# Altium project ARC_1.0.5.PrjPcb (part 3 of 3)

## Sheet Current_Sense_Section.SchDoc
size A4; DocumentNumber: 3; SheetNumber: 3; SheetTotal: 7
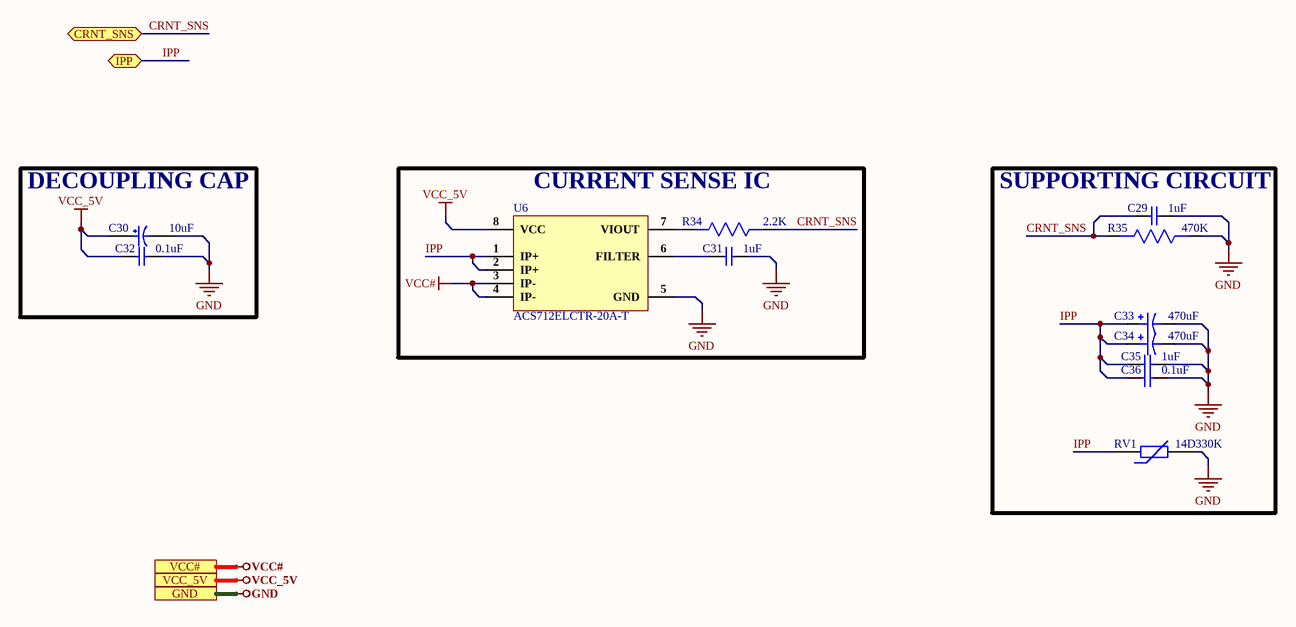
[diagram p5: Current_Sense_Section.SchDoc]

### Parts
C29  1uF  [Cap0603]
C30  10uF  [RVT1E100M0405.]
C31  1uF  [Cap0603]
C32  0.1uF  [Cap0603]
C33  470uF  [VT1H471MI135000CE0]
C34  470uF  [VT1H471MI135000CE0]
C35  1uF  [Cap0603]
C36  0.1uF  [Cap0603]
R34  2.2K  [Res0603]
R35  470K  [Res0603]
RV1  14D330K  [14D330K]
U6  ACS712ELCTR-20A-T  [SOIC-8]

### Blocks framed on the sheet
DECOUPLING CAP: C30 C32
CURRENT SENSE IC: C31 R34 U6
SUPPORTING CIRCUIT: C29 C33-C36 R35 RV1

### Ports
CRNT_SNS (bidir), GND, IPP (bidir), VCC#, VCC_5V

### Nets
GND: C29.2 C30.2 C31.2 C32.2 C33.2 C34.2 C35.2 C36.2 R35.1 RV1.2 U6.5(GND) ; port GND
VCC#: U6.3(IP-) U6.4(IP-) ; port VCC#
VCC_5V: C30.1 C32.1 U6.8(VCC) ; port VCC_5V
CRNT_SNS: C29.1 R34.1 R35.2 ; port CRNT_SNS
IPP: C33.1 C34.1 C35.1 C36.1 RV1.1 U6.1(IP+) U6.2(IP+) ; port IPP
NetC31_1: C31.1 U6.6(FILTER)
NetR34_2: R34.2 U6.7(VIOUT)

### Notes on the sheet
- 1
- Huzaifa Ali

### Library data of the parts
C29 C31 C35 = CL10A105KA8NNNC: CAP CER 1UF 25V X5R 0603; Manufacturer: Sams; Tolerance: 10%; Supplier 1: Digi-Key; Manufacturer Part Number: CL10A105KA8NNNC; Stock 1: 2768758; Pricing 1: 1=0.1, 10=0.036, 50=0.0198, 100=0.0161, 500=0.01152, 1000=0.00904 (USD); Mount: Surface Mount; Case/Package: 0603; Min Operating Temperature: -55°C; Max Operating Temperature: 85°C; Capacitance: 1uF; Dielectric: X5R; Voltage Rating (DC): 25V; Voltage: 25V; Length: 1.6mm; Height: 0.8mm; Depth: 0.8mm; Lead Free: Lead Free; Supplier Part Number 1: 1276-1102-1-ND
C30 = RVT1E100M0405: CAP ALUM 10uF 25V SMD; Manufacturer: ROQANG; φD: 4mm; L: 5.4mm; Tolerance: ±20%; Operating Temperature: -45℃~+105℃; Rated Voltage: 25V; Capacitance: 10uF
C32 C36 = CC0603KRX7R0BB104: CAP CER 0.1UF 100V X7R 0603; Manufacturer: Yageo; Capacitance: 100nF; Tolerance: 10%; Supplier 1: Digi-Key; Manufacturer Part Number: CC0603KRX7R0BB104; RoHS: Yes; Category: Ceramic Capacitors; Stock 1: 60476; Pricing 1: 1=0.19000, 10=0.13500, 50=0.07680, 100=0.06370, 500=0.04466, 1000=0.03696 (USD); Mount: Surface Mount; Case/Package: 0603; Case Code (Metric): 1608; Case Code (Imperial): 0603; Weight: 7.1E-05oz; Min Operating Temperature: -55°C; Max Operating Temperature: 125°C; Package Quantity: 4000; Voltage Rating: 100V; Packaging: Tape and Reel; Dielectric: X7R; Termination: SMD/SMT; Resistor Type: Ceramic; Voltage Rating (DC): 100V; Series: CC; Length: 0.063inch; Width: 0.031inch; Thickness: 0.035inch; Depth: 0.8mm; Lead Free: Lead Free; RoHS Compliant: Yes; ComponentLink1URL: https://datasheet.ciiva.com/6277/mlccorderingcode-6277030.pdf?src-supplier=Digi-Key; ComponentLink1Description: https://datasheet.ciiva.com/6277/mlccorderingcode-6277030.pdf?src-supplier=Digi-Key; ComponentLink2URL: https://datasheet.ciiva.com/6277/mlccorderingcode-6277081.pdf?src-supplier=Digi-Key; ComponentLink2Description: https://datasheet.ciiva.com/6277/mlccorderingcode-6277081.pdf?src-supplier=Digi-Key; ComponentLink3URL: https://datasheet.ciiva.com/6277/mlccorderingcode-6277082.pdf?src-supplier=Digi-Key; ComponentLink3Description: https://datasheet.ciiva.com/6277/mlccorderingcode-6277082.pdf?src-supplier=Digi-Key; Supplier Part Number 1: 311-1523-1-ND
C33 C34 = VT1H471MI135000CE0: 470uF ±20% 50V 12.5mm 13.5mm 1000hrs 105℃ -40℃~+105℃ SMD,12.5x13.5mm Aluminum Electrolytic Capacitors - SMD RoHS; Manufacturer: Changzhou Huawei Elec; Package: SMD,12.5x13.5mm; Capacitance: 470uF; Tolerance: ±20%; Rated Voltage: 50V; φD: 12.5mm; L: 13.5mm; Lifetime @ Temp: 1000hrs 105℃; Operating Temperature: -40℃~+105℃
R34 = RC0603FR-072K2L: RES SMD 2.2K OHM 1% 1/10W 0603; Manufacturer: Yageo Phycomp; Temperature Coefficient: 100ppm/°C; Resistance: 2.2kR; Power Rating: 100mW; Voltage Rating (DC): 50V; Supplier 1: Digi-Key; Manufacturer Part Number: RC0603FR-072K2L; Stock 1: 10587920; Pricing 1: 1=0.1, 10=0.023, 100=0.0094, 1000=0.00421, 2500=0.00366 (USD); Mount: Surface Mount; Case/Package: 0603; Number of Pins: 2; Min Operating Temperature: -55°C; Max Operating Temperature: 155°C; Tolerance: 1%; Packaging: Cut Tape; Length: 1.6mm; Height: 0.45mm; Width: 800um; Depth: 0.8mm; REACH SVHC: No SVHC; Lead Free: Lead Free; Supplier Part Number 1: 311-2.20KHRCT-ND
R35 = AC0603JR-07470KL: RES SMD 470K OHM 5% 1/10W 0603; Manufacturer: Yageo; Resistance: 470kR; Power Rating: 100mW; Voltage Rating: 50V; Temperature Coefficient: 100ppm/°C; ComponentLink1URL: https://datasheet.ciiva.com/11820/0900766b80808d64-11820639.pdf?src-supplier=RSComponents; ComponentLink1Description: https://datasheet.ciiva.com/11820/0900766b80808d64-11820639.pdf?src-supplier=RSComponents; ComponentLink2URL: https://datasheet.ciiva.com/2487/rr-data-sheet-2487286.pdf?src-supplier=Digi-Key; ComponentLink2Description: https://datasheet.ciiva.com/2487/rr-data-sheet-2487286.pdf?src-supplier=Digi-Key; ComponentLink3URL: https://datasheet.ciiva.com/7984/87330-7984374.pdf?src-supplier=Element14; ComponentLink3Description: https://datasheet.ciiva.com/7984/87330-7984374.pdf?src-supplier=Element14; ComponentLink4URL: https://datasheet.ciiva.com/2487/rr-data-sheet-2487287.pdf?src-supplier=Digi-Key; ComponentLink4Description: https://datasheet.ciiva.com/2487/rr-data-sheet-2487287.pdf?src-supplier=Digi-Key; ComponentLink5URL: https://datasheet.ciiva.com/2487/rr-data-sheet-2487288.pdf?src-supplier=Digi-Key; ComponentLink5Description: https://datasheet.ciiva.com/2487/rr-data-sheet-2487288.pdf?src-supplier=Digi-Key; ComponentLink6URL: https://datasheet.ciiva.com/5759/87330-5759049.pdf?src-supplier=Farnell; ComponentLink6Description: https://datasheet.ciiva.com/5759/87330-5759049.pdf?src-supplier=Farnell; Supplier 1: Digi-Key; Manufacturer Part Number: AC0603JR-07470KL; Stock 1: 71; Pricing 1: 1=0.1, 10=0.024, 100=0.0097, 1000=0.0044, 2500=0.0038 (USD); Case/Package: 0603; Case Code (Imperial): 0603; Case Code (Metric): 1608; Weight: 7.1E-05oz; Min Operating Temperature: -55°C; Max Operating Temperature: 155°C; Tolerance: 5%; Packaging: Tape and Reel; Resistor Type: Thick Film; Termination: SMD/SMT; Number of Terminations: 2; Max Power Dissipation: 100mW; Features: Moisture Resistant,Automotive AEC-Q200; Series: AC; Length: 0.063inch; Width: 0.8mm; Height: 0.022inch; RoHS Compliant: Yes; ComponentLink7URL: http://www.mouser.com/ds/2/447/yageodocoutput-1111992.pdf?src-supplier=Mouser; ComponentLink7Description: http://www.mouser.com/ds/2/447/yageodocoutput-1111992.pdf?src-supplier=Mouser; Supplier Part Number 1: YAG3672DKR-ND
RV1 = 14D330K: 65V 5.9J 8500pF@1kHz 26V 20V 30V~36V 1kA Radial Leaded Varistors ROHS; Manufacturer: Hongzhi Elec; Manufacturer Part Number: 14D330K; Footprint: Radial; ComponentLink1Description: LCSC; ComponentLink1URL: https://lcsc.com/product-detail/Varistors_Hongzhi-Elec-14D330K_C137829.html
U6 = ACS712ELCTR-20A-T: SENSOR CURRENT HALL 20A AC/DC; Manufacturer: Allegro MicroSystems; Operating Supply Voltage: 5V; Output Current: 10mA; Max Supply Current: 13mA; Min Supply Voltage: 4.5V; Max Supply Voltage: 5.5V; Bandwidth: 80kHz; Number of Channels: 1; Response Time: 5us; Polarity: Bidirectional; Accuracy: 1.5%; Sensitivity: 100mV/A; Supplier 1: RSComponents; Manufacturer Part Number: ACS712ELCTR-20A-T; RoHS: Yes; Category: Magnetic Sensors; Stock 1: 93; Pricing 1: 1=6.70000, 25=4.23000, 100=3.64000, 250=3.35000, 500=3.04000 (GBP); Case/Package: SOIC; Number of Pins: 8; Min Operating Temperature: -40°C; Max Operating Temperature: 85°C; Package Quantity: 1; Frequency: 80kHz; Packaging: Tape and Reel; Termination: SMD/SMT; Quiescent Current: 10mA; Linearity: 1.5%; Current Sensing: 20A; Series: -; Length: 4.9mm; Width: 3.9mm; Height: 1.5mm; Radiation Hardening: No; REACH SVHC: No SVHC; Lead Free: Lead Free; RoHS Compliant: Yes; ComponentLink1URL: https://datasheet.ciiva.com/15099/getdatasheetpartid-312820-15099471.pdf?src-supplier=Verical; ComponentLink1Description: https://datasheet.ciiva.com/15099/getdatasheetpartid-312820-15099471.pdf?src-supplier=Verical; ComponentLink2URL: https://datasheet.ciiva.com/1165/64754-1165093.pdf?src-supplier=Element14; ComponentLink2Description: https://datasheet.ciiva.com/1165/64754-1165093.pdf?src-supplier=Element14; ComponentLink3URL: https://datasheet.ciiva.com/3272/acs712-datasheet-3272423.pdf?src-supplier=Avnet; ComponentLink3Description: https://datasheet.ciiva.com/3272/acs712-datasheet-3272423.pdf?src-supplier=Avnet; ComponentLink4URL: https://datasheet.ciiva.com/3271/acs712-datasheet-3271995.pdf?src-supplier=Avnet; ComponentLink4Description: https://datasheet.ciiva.com/3271/acs712-datasheet-3271995.pdf?src-supplier=Avnet; ComponentLink5URL: https://datasheet.ciiva.com/16636/acs712-datasheet-16636599.pdf?; ComponentLink5Description: https://datasheet.ciiva.com/16636/acs712-datasheet-16636599.pdf?; Supplier Part Number 1: 6807135

## Sheet RF_Receiver_Section.SchDoc
size 420 x 297 mm; DocumentNumber: 6; SheetNumber: 6; SheetTotal: 7
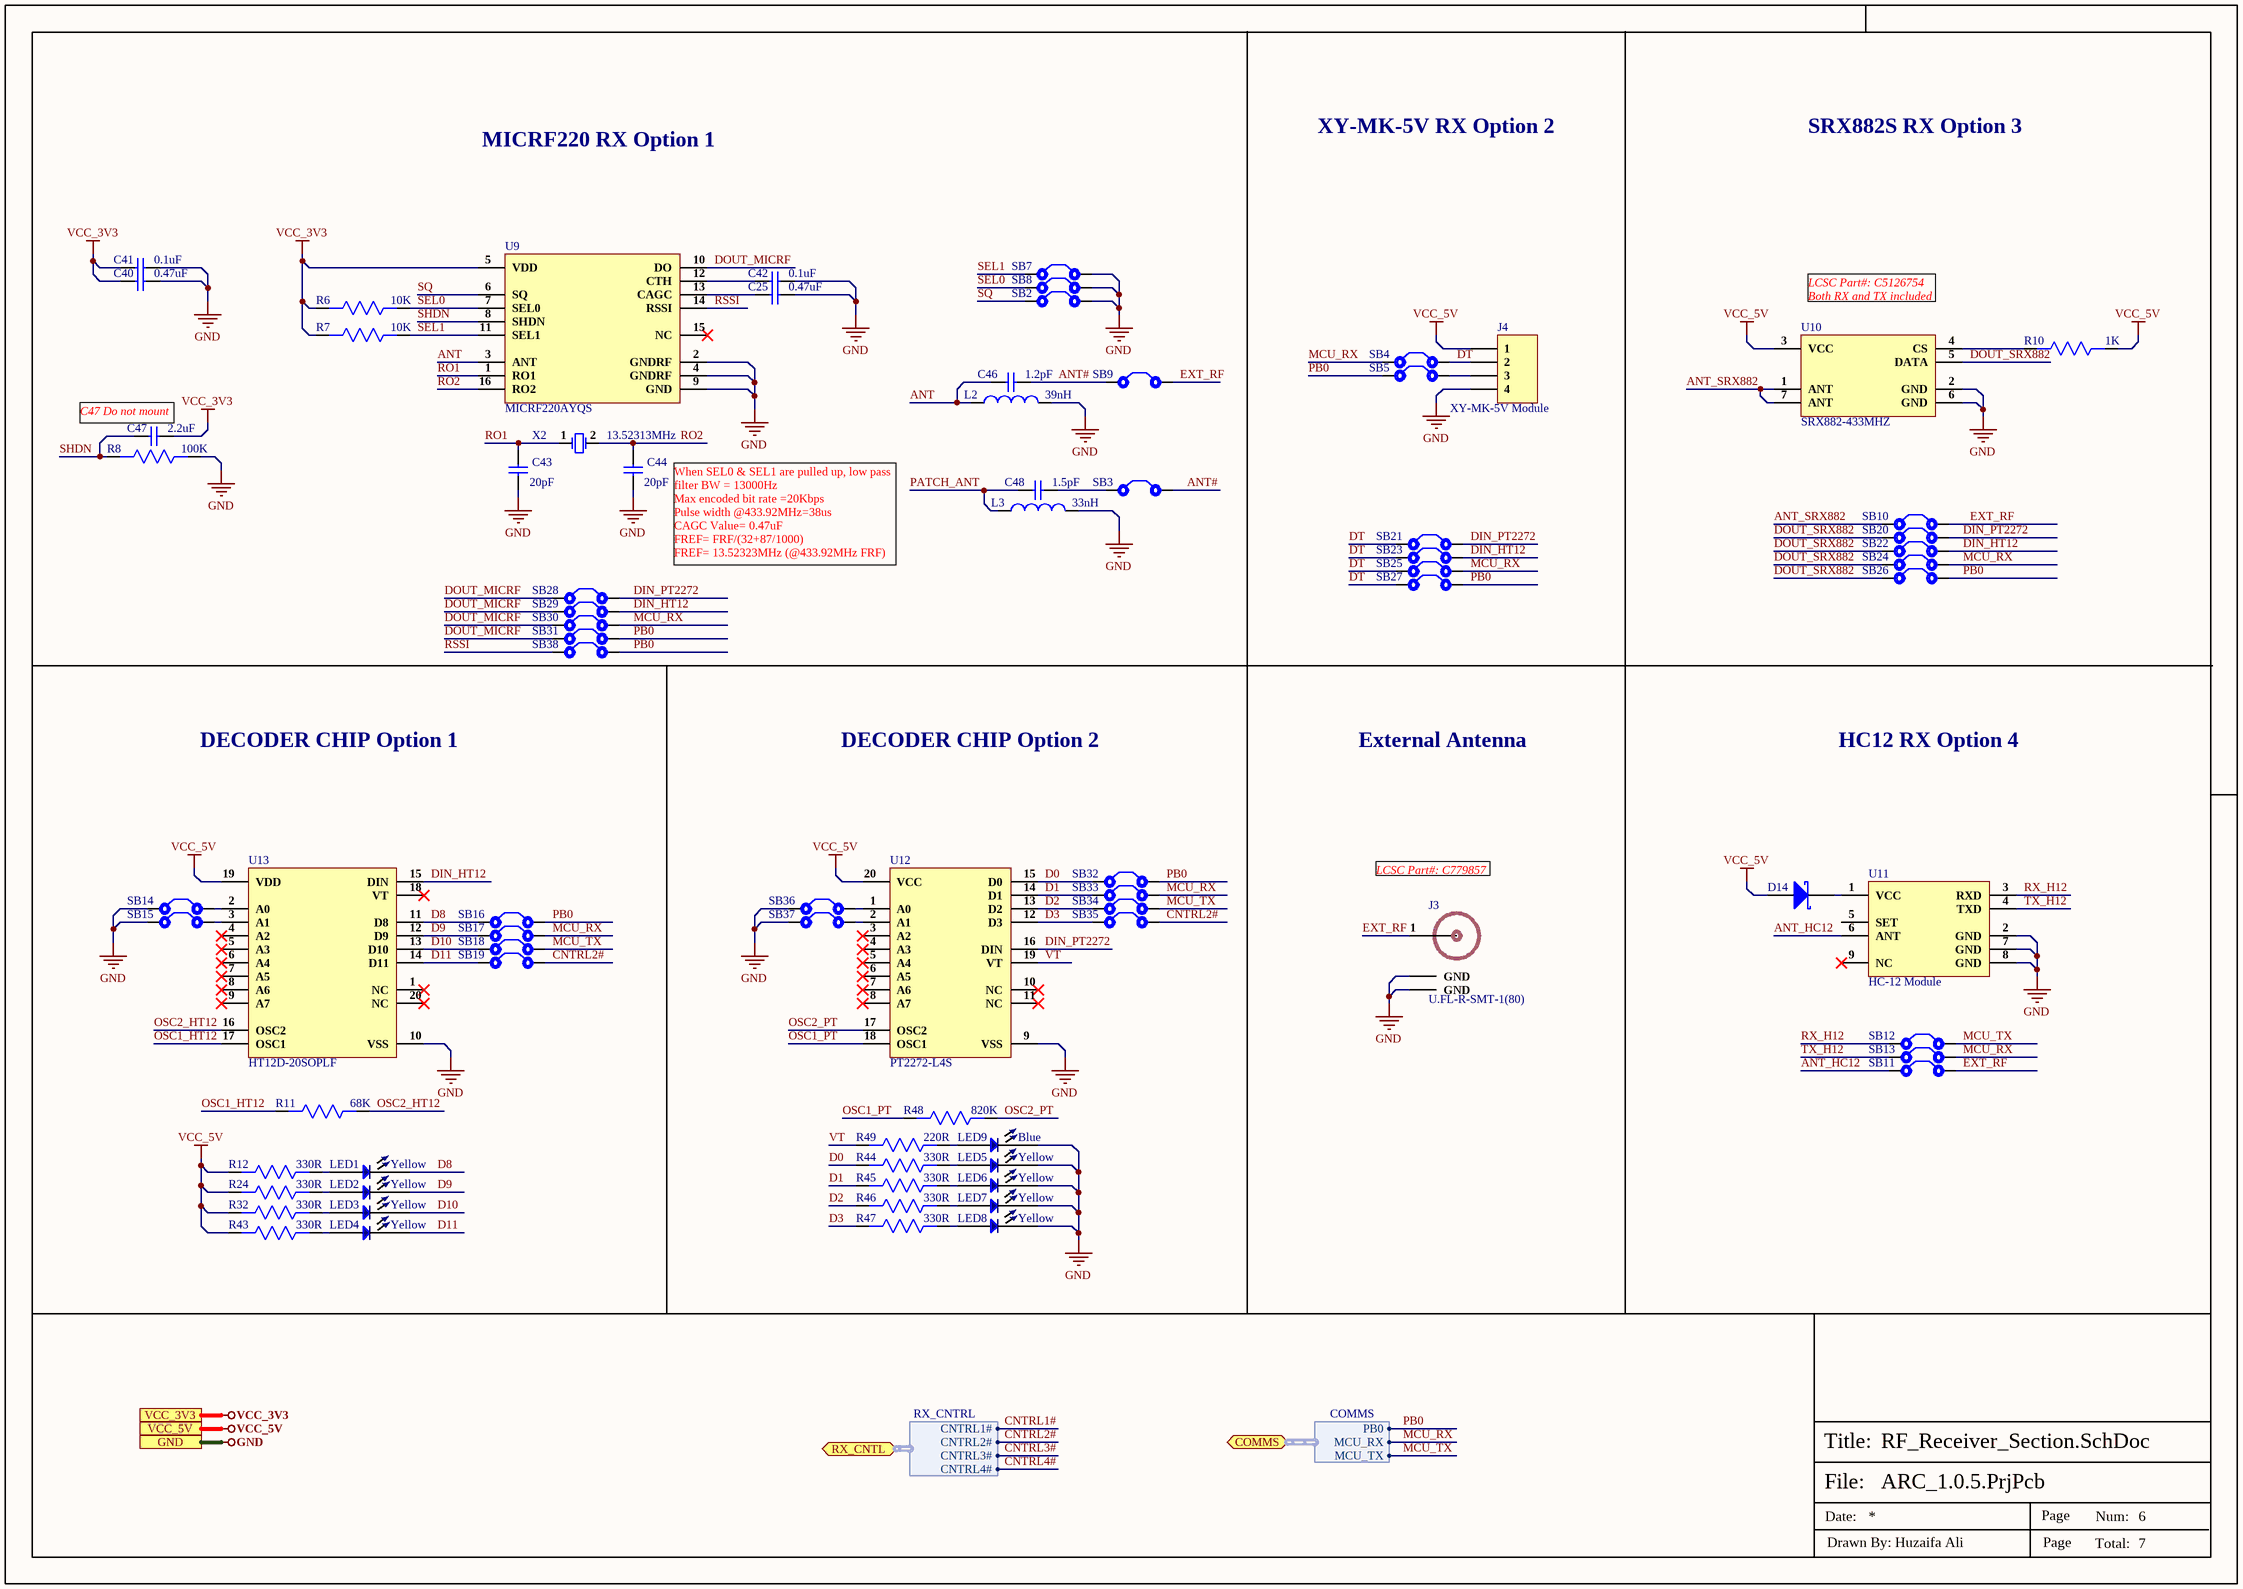
[diagram p6: RF_Receiver_Section.SchDoc]

### Parts
C25  0.47uF  [Cap0603]
C40  0.47uF  [Cap0603]
C41  0.1uF  [Cap0603]
C42  0.1uF  [Cap0603]
C43  20pF  [Cap-0603]
C44  20pF  [Cap-0603]
C46  1.2pF  [Cap0603]
C47  2.2uF  [Cap0603]
C48  1.5pF  [Cap0603]
D14  1N4148WS-7-F  [SOD-323]  (value not drawn)
J3  U.FL-R-SMT-1(80)  [U.FL-R-SMT-1(80)_]
J4  XY-MK-5V Module  [DW254W-11-04-85]
L2  39nH  [IND 0402]
L3  33nH  [IND 0603]
LED1  Yellow  [LED-0402]
LED2  Yellow  [LED-0402]
LED3  Yellow  [LED-0402]
LED4  Yellow  [LED-0402]
LED5  Yellow  [LED-0402]
LED6  Yellow  [LED-0402]
LED7  Yellow  [LED-0402]
LED8  Yellow  [LED-0402]
LED9  Blue  [LED-0402]
R6  10K  [Res0603]
R7  10K  [Res0603]
R8  100K  [Res0603]
R10  1K  [Res-0603]
R11  68K  [Res-0603]
R12  330R  [Res-0603]
R24  330R  [Res-0603]
R32  330R  [Res-0603]
R43  330R  [Res-0603]
R44  330R  [Res-0603]
R45  330R  [Res-0603]
R46  330R  [Res-0603]
R47  330R  [Res-0603]
R48  820K  [Res-0603]
R49  220R  [Res-0603]
SB2  Solder Bridge  [Solder Bridge]  (value not drawn)
SB3  Solder Bridge  [Solder Bridge]  (value not drawn)
SB4  Solder Bridge  [Solder Bridge]  (value not drawn)
SB5  Solder Bridge  [Solder Bridge]  (value not drawn)
SB7  Solder Bridge  [Solder Bridge]  (value not drawn)
SB8  Solder Bridge  [Solder Bridge]  (value not drawn)
SB9  Solder Bridge  [Solder Bridge]  (value not drawn)
SB10  Solder Bridge  [Solder Bridge]  (value not drawn)
SB11  Solder Bridge  [Solder Bridge]  (value not drawn)
SB12  Solder Bridge  [Solder Bridge]  (value not drawn)
SB13  Solder Bridge  [Solder Bridge]  (value not drawn)
SB14  Solder Bridge  [Solder Bridge]  (value not drawn)
SB15  Solder Bridge  [Solder Bridge]  (value not drawn)
SB16  Solder Bridge  [Solder Bridge]  (value not drawn)
SB17  Solder Bridge  [Solder Bridge]  (value not drawn)
SB18  Solder Bridge  [Solder Bridge]  (value not drawn)
SB19  Solder Bridge  [Solder Bridge]  (value not drawn)
SB20  Solder Bridge  [Solder Bridge]  (value not drawn)
SB21  Solder Bridge  [Solder Bridge]  (value not drawn)
SB22  Solder Bridge  [Solder Bridge]  (value not drawn)
SB23  Solder Bridge  [Solder Bridge]  (value not drawn)
SB24  Solder Bridge  [Solder Bridge]  (value not drawn)
SB25  Solder Bridge  [Solder Bridge]  (value not drawn)
SB26  Solder Bridge  [Solder Bridge]  (value not drawn)
SB27  Solder Bridge  [Solder Bridge]  (value not drawn)
SB28  Solder Bridge  [Solder Bridge]  (value not drawn)
SB29  Solder Bridge  [Solder Bridge]  (value not drawn)
SB30  Solder Bridge  [Solder Bridge]  (value not drawn)
SB31  Solder Bridge  [Solder Bridge]  (value not drawn)
SB32  Solder Bridge  [Solder Bridge]  (value not drawn)
SB33  Solder Bridge  [Solder Bridge]  (value not drawn)
SB34  Solder Bridge  [Solder Bridge]  (value not drawn)
SB35  Solder Bridge  [Solder Bridge]  (value not drawn)
SB36  Solder Bridge  [Solder Bridge]  (value not drawn)
SB37  Solder Bridge  [Solder Bridge]  (value not drawn)
SB38  Solder Bridge  [Solder Bridge]  (value not drawn)
U9  MICRF220AYQS  [16-QSOP]
U10  SRX882-433MHZ  [SRX882-433MHZ]
U11  HC-12 Module  [HC-12 Module]
U12  PT2272-L4S  [SOP-20 (300 Mil)]
U13  HT12D-20SOPLF  [SOP-20 (300 Mil)]
X2  13.52313MHz  [HC-49S-2P]

### Ports
COMMS (bidir, harness COMMS), GND, RX_CNTL (bidir, harness RX_CNTRL), VCC_3V3, VCC_5V

### Harnesses
COMMS: PB0, MCU_RX, MCU_TX
RX_CNTRL: CNTRL1#, CNTRL2#, CNTRL3#, CNTRL4#

### Nets
GND: C25.2 C40.2 C41.2 C42.2 C43.1 C44.1 J3.2(GND) J3.3(GND) J4.4 L2.2 L3.2 LED5.2 LED6.2 LED7.2 LED8.2 LED9.2 R8.1 SB2.2 SB7.2 SB8.2 SB14.1 SB15.1 SB36.1 SB37.1 U9.2(GNDRF) U9.4(GNDRF) U9.9(GND) U10.2(GND) U10.6(GND) U11.2(GND) U11.7(GND) U11.8(GND) U12.9(VSS) U13.10(VSS) ; port GND
VCC_3V3: C40.1 C41.1 C47.2 R6.2 R7.2 U9.5(VDD) ; port VCC_3V3
VCC_5V: D14.2(A) J4.1 R10.1 R12.2 R24.2 R32.2 R43.2 U10.3(VCC) U12.20(VCC) U13.19(VDD) ; port VCC_5V
ANT: C46.1 L2.1 U9.3(ANT)
ANT#: C46.2 SB3.2 SB9.1
ANT_HC12: SB11.1 U11.6(ANT)
ANT_SRX882: SB10.1 U10.1(ANT) U10.7(ANT)
CNTRL1#: port RX_CNTL.CNTRL1#
CNTRL2#: SB19.2 SB35.2 ; port RX_CNTL.CNTRL2#
D0: R44.2 SB32.1 U12.15(D0)
D1: R45.2 SB33.1 U12.14(D1)
D2: R46.2 SB34.1 U12.13(D2)
D3: R47.2 SB35.1 U12.12(D3)
D8: LED1.2 SB16.1 U13.11(D8)
D9: LED2.2 SB17.1 U13.12(D9)
D10: LED3.2 SB18.1 U13.13(D10)
D11: LED4.2 SB19.1 U13.14(D11)
DIN_HT12: SB22.2 SB23.2 SB29.2 U13.15(DIN)
DIN_PT2272: SB20.2 SB21.2 SB28.2 U12.16(DIN)
DOUT_MICRF: SB28.1 SB29.1 SB30.1 SB31.1 U9.10(DO)
DOUT_SRX882: SB20.1 SB22.1 SB24.1 SB26.1 U10.5(DATA)
DT: J4.2 SB4.2 SB21.1 SB23.1 SB25.1 SB27.1
EXT_RF: J3.1(RF_IN) SB9.2 SB10.2 SB11.2
MCU_RX: SB4.1 SB13.2 SB17.2 SB24.2 SB25.2 SB30.2 SB33.2 ; port COMMS.MCU_RX
MCU_TX: SB12.2 SB18.2 SB34.2 ; port COMMS.MCU_TX
OSC1_HT12: R11.2 U13.17(OSC1)
OSC1_PT: R48.2 U12.18(OSC1)
OSC2_HT12: R11.1 U13.16(OSC2)
OSC2_PT: R48.1 U12.17(OSC2)
PATCH_ANT: C48.1 L3.1
PB0: SB5.1 SB16.2 SB26.2 SB27.2 SB31.2 SB32.2 SB38.2 ; port COMMS.PB0
RO1: C43.2 U9.1(RO1) X2.1(OSC1)
RO2: C44.2 U9.16(RO2) X2.2(OSC2)
RSSI: SB38.1 U9.14(RSSI)
RX_H12: SB12.1 U11.3(RXD)
SEL0: R6.1 SB8.1 U9.7(SEL0)
SEL1: R7.1 SB7.1 U9.11(SEL1)
SHDN: C47.1 R8.2 U9.8(SHDN)
SQ: SB2.1 U9.6(SQ)
TX_H12: SB13.1 U11.4(TXD)
VT: R49.2 U12.19(VT)
NetC25_1: C25.1 U9.13(CAGC)
NetC42_1: C42.1 U9.12(CTH)
NetC48_2: C48.2 SB3.1
NetD14_1: D14.1(K) U11.1(VCC)
NetJ4_3: J4.3 SB5.2
NetLED1_1: LED1.1 R12.1
NetLED2_1: LED2.1 R24.1
NetLED3_1: LED3.1 R32.1
NetLED4_1: LED4.1 R43.1
NetLED5_1: LED5.1 R44.1
NetLED6_1: LED6.1 R45.1
NetLED7_1: LED7.1 R46.1
NetLED8_1: LED8.1 R47.1
NetLED9_1: LED9.1 R49.1
NetR10_2: R10.2 U10.4(CS)
NetSB14_2: SB14.2 U13.2(A0)
NetSB15_2: SB15.2 U13.3(A1)
NetSB36_2: SB36.2 U12.1(A0)
NetSB37_2: SB37.2 U12.2(A1)

Not connected (* = marked no-connect by the designer): U9 15(NC)*; U11 5(SET) 9(NC)*; U12 3(A2)* 4(A3)* 5(A4)* 6(A5)* 7(A6)* 8(A7)* 10(NC)* 11(NC)*; U13 1(NC)* 4(A2)* 5(A3)* 6(A4)* 7(A5)* 8(A6)* 9(A7)* 18(VT)* 20(NC)*

### Notes on the sheet
- XY-MK-5V RX Option 2
- SRX882S RX Option 3
- MICRF220 RX Option 1
- (near U10) LCSC Part#: C5126754
  Both RX and TX included
- (near C47) C47 Do not mount
- (near C44) When SEL0 & SEL1 are pulled up, low pass filter BW = 13000Hz
  Max encoded bit rate =20Kbps
  Pulse width @433.92MHz=38us
  CAGC Value= 0.47uF
  FREF= FRF/(32+87/1000)
  FREF= 13.52323MHz (@433.92MHz FRF)
- DECODER CHIP Option 1
- DECODER CHIP Option 2
- External Antenna
- HC12 RX Option 4
- LCSC Part#: C779857
- File:
- Title:
- Date:
- Page
- Num:
- Total:
- Drawn By: Huzaifa Ali

### Library data of the parts
C25 C40 = UMK107B7474KA-TR: CAP CER 0.47uF 50V X7R 0603; Manufacturer: Taiyo Yuden; Tolerance: 10%; Capacitance: 470nF; Supplier 1: Digi-Key; Manufacturer Part Number: UMK107B7474KA-TR; RoHS: Yes; Category: Ceramic Capacitors; Stock 1: 81; Pricing 1: 1=0.21000, 10=0.14800, 50=0.08400, 100=0.06950, 500=0.04876, 1000=0.04036 (USD); Mount: Surface Mount; Case/Package: 0603; Case Code (Metric): 1608; Case Code (Imperial): 0603; Min Operating Temperature: -55°C; Max Operating Temperature: 125°C; Packaging: Tape and Reel; Voltage Rating: 50V; Package Quantity: 1; Dielectric: X7R; Termination: SMD/SMT; Voltage: 50V; Series: M; Voltage Rating (DC): 50V; Construction: Flat; Length: 1.6mm; Width: 0.031inch; Height: 0.8mm; Depth: 0.8mm; Thickness: 0.035inch; Radiation Hardening: No; RoHS Compliant: Yes; Lead Free: Lead Free; Halogen Free: Halogen Free; ComponentLink1URL: https://datasheet.ciiva.com/30063/972umk107b7474ka-tr-30063804.pdf?src-supplier=Onlinecomponents.com; ComponentLink1Description: https://datasheet.ciiva.com/30063/972umk107b7474ka-tr-30063804.pdf?src-supplier=Onlinecomponents.com; ComponentLink2URL: https://datasheet.ciiva.com/11600/umk107b7474ka-tr-ss-11600367.pdf?src-supplier=Avnet; ComponentLink2Description: https://datasheet.ciiva.com/11600/umk107b7474ka-tr-ss-11600367.pdf?src-supplier=Avnet; ComponentLink3URL: https://datasheet.ciiva.com/15922/257umk107b7474ka-tr-15922607.pdf?src-supplier=Onlinecomponents.com; ComponentLink3Description: https://datasheet.ciiva.com/15922/257umk107b7474ka-tr-15922607.pdf?src-supplier=Onlinecomponents.com; ComponentLink4URL: https://datasheet.ciiva.com/6274/mlcc-all-e-6274710.pdf?src-supplier=Digi-Key; ComponentLink4Description: https://datasheet.ciiva.com/6274/mlcc-all-e-6274710.pdf?src-supplier=Digi-Key; ComponentLink5URL: https://datasheet.ciiva.com/5412/mlcc01-e-5412119.pdf?src-supplier=Mouser; ComponentLink5Description: https://datasheet.ciiva.com/5412/mlcc01-e-5412119.pdf?src-supplier=Mouser; ComponentLink6URL: https://datasheet.ciiva.com/6274/mlcc-all-e-6274712.pdf?src-supplier=Digi-Key; ComponentLink6Description: https://datasheet.ciiva.com/6274/mlcc-all-e-6274712.pdf?src-supplier=Digi-Key; ComponentLink7URL: https://datasheet.ciiva.com/6274/mlcc-all-e-6274713.pdf?src-supplier=Digi-Key; ComponentLink7Description: https://datasheet.ciiva.com/6274/mlcc-all-e-6274713.pdf?src-supplier=Digi-Key; Supplier Part Number 1: 587-3170-1-ND
C41 C42 = CC0603KRX7R0BB104: as C32 on sheet Current_Sense_Section; Supplier 1: Digi-Key; Manufacturer Part Number: CC0603KRX7R0BB104; RoHS: Yes; Category: Ceramic Capacitors; Stock 1: 60476; Pricing 1: 1=0.19000, 10=0.13500, 50=0.07680, 100=0.06370, 500=0.04466, 1000=0.03696 (USD); Mount: Surface Mount; Case/Package: 0603; Case Code (Metric): 1608; Case Code (Imperial): 0603; Weight: 7.1E-05oz; Min Operating Temperature: -55°C; Max Operating Temperature: 125°C; Package Quantity: 4000; Voltage Rating: 100V; Packaging: Tape and Reel; Dielectric: X7R; Termination: SMD/SMT; Resistor Type: Ceramic; Voltage Rating (DC): 100V; Series: CC; Length: 0.063inch; Width: 0.031inch; Thickness: 0.035inch; Depth: 0.8mm; Lead Free: Lead Free; RoHS Compliant: Yes; ComponentLink1URL: https://datasheet.ciiva.com/6277/mlccorderingcode-6277030.pdf?src-supplier=Digi-Key; ComponentLink1Description: https://datasheet.ciiva.com/6277/mlccorderingcode-6277030.pdf?src-supplier=Digi-Key; ComponentLink2URL: https://datasheet.ciiva.com/6277/mlccorderingcode-6277081.pdf?src-supplier=Digi-Key; ComponentLink2Description: https://datasheet.ciiva.com/6277/mlccorderingcode-6277081.pdf?src-supplier=Digi-Key; ComponentLink3URL: https://datasheet.ciiva.com/6277/mlccorderingcode-6277082.pdf?src-supplier=Digi-Key; ComponentLink3Description: https://datasheet.ciiva.com/6277/mlccorderingcode-6277082.pdf?src-supplier=Digi-Key; Supplier Part Number 1: 311-1523-1-ND
C43 C44 = CC0603JRNPO9BN200: CAP CER 20PF 50V C0G/NPO 0603; Manufacturer: Yageo; Tolerance: 5%; Dielectric: C0G; Supplier 1: Digi-Key; Manufacturer Part Number: CC0603JRNPO9BN200; Stock 1: 259568; Pricing 1: 1=0.1, 10=0.048, 100=0.0214, 500=0.01526, 1000=0.01198 (USD); Mount: Surface Mount; Case/Package: 0603; Number of Pins: 2; Weight: 7.1E-05oz; Case Code (Imperial): 0603; Case Code (Metric): 1608; Min Operating Temperature: -55°C; Max Operating Temperature: 125°C; Capacitance: 20pF; Package Quantity: 4000; Voltage Rating (DC): 50V; Packaging: Tape and Reel; Voltage Rating: 50V; Termination: SMD/SMT; Composition: Ceramic; Length: 1.6mm; Width: 0.8mm; Thickness: 0.035inch; Depth: 0.8mm; REACH SVHC: Unknown; Lead Free: Lead Free; ComponentLink1URL: http://www.farnell.com/datasheets/1132289.pdf?src-supplier=Element14; ComponentLink1Description: http://www.farnell.com/datasheets/1132289.pdf?src-supplier=Element14; ComponentLink2URL: http://www.yageo.com/documents/recent/UPY-GP_NP0_16V-to-50V_16.pdf?src-supplier=Digi-Key; ComponentLink2Description: http://www.yageo.com/documents/recent/UPY-GP_NP0_16V-to-50V_16.pdf?src-supplier=Digi-Key; Supplier Part Number 1: 311-1424-6-ND; LCSC Part Number: C105621
C46 = CC0603CRNPO9BN1R2: CAP CER 1.2PF 50V C0G/NPO 0603; Manufacturer: Yageo; Dielectric: C0G; Insulation Resistance: 10GR; Supplier 1: Arrow Electronics; Manufacturer Part Number: CC0603CRNPO9BN1R2; RoHS: Yes; Category: Ceramic Capacitors; Stock 1: 8000; Pricing 1: 4000=0.00980, 8000=0.00850, 12000=0.00840, 40000=0.00420 (USD); Mount: Surface Mount; Case/Package: 0603; Case Code (Imperial): 0603; Case Code (Metric): 1608; Weight: 7.1E-05oz; Min Operating Temperature: -55°C; Max Operating Temperature: 125°C; Capacitance: 1.2pF; Package Quantity: 4000; Voltage Rating: 50V; Voltage Rating (DC): 50V; Packaging: Tape and Reel; Termination: SMD/SMT; Resistor Type: Ceramic; Series: CC; Length: 1.6mm; Width: 0.031inch; Height: 0.8mm; Thickness: 0.035inch; Depth: 0.8mm; Radiation Hardening: No; REACH SVHC: No SVHC; Lead Free: Lead Free; RoHS Compliant: Yes; ComponentLink1URL: https://datasheet.ciiva.com/26862/getdatasheetpartid-403496-26862685.pdf?src-supplier=Verical; ComponentLink1Description: https://datasheet.ciiva.com/26862/getdatasheetpartid-403496-26862685.pdf?src-supplier=Verical; ComponentLink2URL: https://datasheet.ciiva.com/13209/upy-gp-np0-16v-to-50v-8-13209833.pdf?src-supplier=Mouser; ComponentLink2Description: https://datasheet.ciiva.com/13209/upy-gp-np0-16v-to-50v-8-13209833.pdf?src-supplier=Mouser; ComponentLink3URL: https://datasheet.ciiva.com/8033/1443161-8033679.pdf?src-supplier=Element14; ComponentLink3Description: https://datasheet.ciiva.com/8033/1443161-8033679.pdf?src-supplier=Element14; ComponentLink4URL: https://datasheet.ciiva.com/8033/1443161-8033677.pdf?src-supplier=Element14; ComponentLink4Description: https://datasheet.ciiva.com/8033/1443161-8033677.pdf?src-supplier=Element14; ComponentLink5URL: https://datasheet.ciiva.com/11586/upy-gp-np0-16v-to-50v-8-11586438.pdf?src-supplier=Avnet; ComponentLink5Description: https://datasheet.ciiva.com/11586/upy-gp-np0-16v-to-50v-8-11586438.pdf?src-supplier=Avnet; Supplier Part Number 1: CC0603CRNPO9BN1R2
C47 = UMK107BBJ225MA-T: CAP CER 2.2UF 50V X5R 0603; Manufacturer: Taiyo Yuden; Supplier 1: Digi-Key; Manufacturer Part Number: UMK107BBJ225MA-T; RoHS: Yes; Category: Ceramic Capacitors; Stock 1: 1; Pricing 1: 1=0.26000, 10=0.18100, 50=0.12060, 100=0.10240, 500=0.07232, 1000=0.06327 (USD); RoHS Compliant: Yes; Supplier Part Number 1: 587-6298-1-ND
C48 = CC0603CRNPO9BN1R5: CAP CER 1.5PF 50V C0G/NPO 0603; Manufacturer: Yageo; Dielectric: C0G; Temperature Coefficient: 30ppm/°C; Insulation Resistance: 10GR; Supplier 1: Digi-Key; Manufacturer Part Number: CC0603CRNPO9BN1R5; Stock 1: 34794; Pricing 1: 1=0.1, 10=0.058, 100=0.0259, 500=0.01852, 1000=0.01455 (USD); Mount: Surface Mount; Case/Package: 0603; Weight: 7.1E-05oz; Case Code (Metric): 1608; Case Code (Imperial): 0603; Min Operating Temperature: -55°C; Max Operating Temperature: 125°C; Capacitance: 1.5pF; Voltage Rating: 50V; Voltage Rating (DC): 50V; Package Quantity: 1; Packaging: Tape and Reel; Termination: SMD/SMT; Composition: Ceramic; Voltage: 50V; Length: 1.6mm; Height: 0.8mm; Width: 0.031inch; Thickness: 0.035inch; Depth: 0.8mm; Radiation Hardening: No; REACH SVHC: Unknown; Lead Free: Lead Free; ComponentLink1URL: http://www.yageo.com/documents/recent/UPY-GP_NP0_16V-to-50V_16.pdf?src-supplier=Digi-Key; ComponentLink1Description: http://www.yageo.com/documents/recent/UPY-GP_NP0_16V-to-50V_16.pdf?src-supplier=Digi-Key; ComponentLink2URL: http://www.yageo.com/exep/pages/download/literatures/ProductSelectionGuide%202014_Final_2.pdf?src-supplier=Digi-Key; ComponentLink2Description: http://www.yageo.com/exep/pages/download/literatures/ProductSelectionGuide%202014_Final_2.pdf?src-supplier=Digi-Key; ComponentLink3URL: http://www.mouser.com/ds/2/447/Yageo_UPY-GP_NP0_16V-to-50V_9-358835.pdf?src-supplier=Mouser; ComponentLink3Description: http://www.mouser.com/ds/2/447/Yageo_UPY-GP_NP0_16V-to-50V_9-358835.pdf?src-supplier=Mouser; ComponentLink4URL: http://www.yageo.com/documents/recent/UPY-GP_NP0_16V-to-50V_8.pdf?src-supplier=Avnet; ComponentLink4Description: http://www.yageo.com/documents/recent/UPY-GP_NP0_16V-to-50V_8.pdf?src-supplier=Avnet; ComponentLink5URL: http://www.yageo.com/documents/recent/UPY-GP_NP0_16V-to-50V_8.pdf?src-supplier=Avnet+Europe; ComponentLink5Description: http://www.yageo.com/documents/recent/UPY-GP_NP0_16V-to-50V_8.pdf?src-supplier=Avnet+Europe; ComponentLink6URL: https://www.verical.com/server-webapp/html/getDatasheet?partID=38063&src-supplier=Verical; ComponentLink6Description: https://www.verical.com/server-webapp/html/getDatasheet?partID=38063&src-supplier=Verical; Supplier Part Number 1: 311-1050-6-ND
D14 = 1N4148WS-7-F: DIODE GEN PURP 75V 150MA SOD323; Manufacturer: Diodes; Forward Current: 300mA; Reverse Recovery Time: 4ns; Element Configuration: Single; Forward Voltage: 1.25V; Max Reverse Current: 1uA; Peak Non-Repetitive Surge Current: 2A; Power Dissipation: 200mW; Polarity: Standard; Capacitance: 2pF; Supplier 1: Mouser; Manufacturer Part Number: 1N4148WS-7-F; RoHS: Yes; Category: Rectifier Diodes; Pricing 1: 1=0.19000, 10=0.17500, 50=0.17500, 100=0.09600, 500=0.05900, 1000=0.04000, 3000=0.03000, 9000=0.02600, 10000=0.02600, 24000=0.02300, 45000=0.01900 (USD); Mount: Surface Mount; Number of Pins: 2; Weight: 0.000173oz; Contact Plating: Tin,Matte; Min Operating Temperature: -65°C; Max Operating Temperature: 150°C; Max Repetitive Reverse Voltage (Vrrm): 75V; Max Forward Surge Current (Ifsm): 2A; Max Surge Current: 2A; Packaging: Tape and Reel; Recovery Time: 4ns; Package Quantity: 3000; Average Rectified Current: 150mA; Voltage Rating (DC): 75V; Power Rating: 200mW; Current Rating: 150mA; Output Current: 150mA; Voltage: 75V; Max Reverse Voltage (DC): 75V; Series: -; Reverse Recovery Time-Max: 4ns; Length: 1.8mm; Width: 1.4mm; Height: 1mm; Radiation Hardening: No; REACH SVHC: No SVHC; Lead Free: Lead Free; RoHS Compliant: Yes; ComponentLink1URL: https://datasheet.ciiva.com/1179/ds30097-1179355.pdf?src-supplier=Element14; ComponentLink1Description: https://datasheet.ciiva.com/1179/ds30097-1179355.pdf?src-supplier=Element14; ComponentLink2URL: https://datasheet.ciiva.com/8300/ds30097-8300396.pdf?src-supplier=Avnet; ComponentLink2Description: https://datasheet.ciiva.com/8300/ds30097-8300396.pdf?src-supplier=Avnet; ComponentLink3URL: https://datasheet.ciiva.com/16199/ds30097-16199061.pdf?src-supplier=Future+Electronics; ComponentLink3Description: https://datasheet.ciiva.com/16199/ds30097-16199061.pdf?src-supplier=Future+Electronics; ComponentLink4URL: https://datasheet.ciiva.com/911/ds30097-911742.pdf?src-supplier=Digi-Key; ComponentLink4Description: https://datasheet.ciiva.com/911/ds30097-911742.pdf?src-supplier=Digi-Key; ComponentLink5URL: https://datasheet.ciiva.com/911/ds30097-911743.pdf?src-supplier=Digi-Key; ComponentLink5Description: https://datasheet.ciiva.com/911/ds30097-911743.pdf?src-supplier=Digi-Key; ComponentLink6URL: https://datasheet.ciiva.com/911/ds30097-911741.pdf?src-supplier=Digi-Key; ComponentLink6Description: https://datasheet.ciiva.com/911/ds30097-911741.pdf?src-supplier=Digi-Key; Supplier Part Number 1: 621-1N4148WS-F; LCSC Part Number: C60580
J3 = U.FL-R-SMT-1(80): CONN U.FL RCPT STR 50 OHM SMD; Manufacturer: Hirose; Supplier 1: Future Electronics; Manufacturer Part Number: U.FL-R-SMT-1(80); Stock 1: 1272; Pricing 1: 1=1.07, 500=0.785, 1500=0.74, 2500=0.72, 5000=0.695 (USD); Case/Package: SMD/SMT; Package Quantity: 10000; Packaging: Tape and Reel; Lead Free: Lead Free; ComponentLink1URL: https://www.hirose.com/product/en/download_file/key_name/U.FL-R-SMT-1%2880%29/category/Specification%20Sheet/doc_file_id/37638/?file_category_id=9&item_id=03310472280&is_series=&src-supplier=Digi-Key; ComponentLink1Description: https://www.hirose.com/product/en/download_file/key_name/U.FL-R-SMT-1%2880%29/category/Specification%20Sheet/doc_file_id/37638/?file_category_id=9&item_id=03310472280&is_series=&src-supplier=Digi-Key; ComponentLink2URL: http://www.mouser.com/ds/2/185/U.FL_catalog-939761.pdf?src-supplier=Mouser; ComponentLink2Description: http://www.mouser.com/ds/2/185/U.FL_catalog-939761.pdf?src-supplier=Mouser; Supplier Part Number 1: U.FL-R-SMT-1(80)-CUTT; LCSC Part Number: C88374
J4 = DW254W-11-04-85: 4 PIN 2.54mm 3A Female Headers; Manufacturer: DEALON; Holes Structure: 1x4P; Holes Direction: side; Pitch: 2.54mm; Current Rating (Max): 3A; Mounting Type: Shrouded; ComponentLink1Description: LCSC; ComponentLink1URL: https://lcsc.com/product-detail/span-style-background-color-ff0-Female-span-Headers_DEALON-DW254W-11-04-85_C2935994.html
L2 = LQW15AN39NG80D: FIXED IND 39NH 530MA 456MOHM SMD; Manufacturer: Murata; Core Material: Non-Magnetic; Shielding: Unshielded; Tolerance: 2%; DC Resistance (DCR): 456mR; Self Resonant Frequency: 3.4GHz; Test Frequency: 100MHz; Q Factor: 28; Supplier 1: Arrow Electronics; Manufacturer Part Number: LQW15AN39NG80D; RoHS: Yes; Category: Fixed Inductors; Stock 1: 7835; Pricing 1: 1=0.25260, 10=0.20140, 25=0.19280, 100=0.14770, 250=0.13910, 500=0.12490, 1000=0.10220, 3000=0.08400, 6000=0.08290 (USD); Mount: Surface Mount; Case/Package: 0402; Case Code (Metric): 1005; Case Code (Imperial): 0402; Min Operating Temperature: -55°C; Max Operating Temperature: 125°C; Current Rating: 530mA; Packaging: Tape and Reel; Package Quantity: 1; Resistor Type: Wirewound; Inductance: 39nH; Max DC Current: 530mA; Termination: SMD/SMT; Length: 0.039inch; Width: 0.024inch; Height: 0.5mm; Height - Seated (Max): 0.024inch; RoHS Compliant: Yes; ComponentLink1URL: https://datasheet.ciiva.com/24054/product-260692-24054907.pdf?src-supplier=Mouser; ComponentLink1Description: https://datasheet.ciiva.com/24054/product-260692-24054907.pdf?src-supplier=Mouser; ComponentLink2URL: https://datasheet.ciiva.com/29696/l0075e-29696874.pdf?src-supplier=Digi-Key; ComponentLink2Description: https://datasheet.ciiva.com/29696/l0075e-29696874.pdf?src-supplier=Digi-Key; ComponentLink3URL: https://datasheet.ciiva.com/29696/l0075e-29696875.pdf?src-supplier=Digi-Key; ComponentLink3Description: https://datasheet.ciiva.com/29696/l0075e-29696875.pdf?src-supplier=Digi-Key; ComponentLink4URL: https://datasheet.ciiva.com/29696/l0075e-29696876.pdf?src-supplier=Digi-Key; ComponentLink4Description: https://datasheet.ciiva.com/29696/l0075e-29696876.pdf?src-supplier=Digi-Key; Supplier Part Number 1: LQW15AN39NG80D
L3 = HSC0603-33NJ-T: 600mA 33nH ±5% 220mΩ SMD,1.8x1.2x1.02mm Inductors (SMD) ROHS; Manufacturer: EMTEK; Manufacturer Part Number: HSC0603-33NJ-T; Value: 33nH; ComponentLink1Description: LCSC; ComponentLink1URL: https://www.lcsc.com/product-detail/Inductors-span-style-background-color-ff0-SMD-span_EMTEK-HSC0603-33NJ-T_C251779.html
LED1-LED8 = XZMYK68W-2: LED YELLOW CLEAR CHIP SMD; Manufacturer: SunLED; Lens Color: Colorless; Luminous Intensity: 148mcd; Test Current: 20mA; Viewing Angle: 120°; Dominant Wavelength: 590nm; Forward Voltage: 2V; Supplier 1: Digi-Key; Manufacturer Part Number: XZMYK68W-2; RoHS: Yes; Category: LEDs; Stock 1: 36021; Pricing 1: 1=0.36000, 10=0.28400, 100=0.12770, 500=0.11536, 1000=0.09476 (USD); Mount: Surface Mount; Case/Package: 0402; Color: Yellow; Case Code (Metric): 1005; Case Code (Imperial): 0402; Packaging: Tape and Reel; Lens Transparency: Clear; Length: 1mm; Width: 0.5mm; Height: 0.6mm; RoHS Compliant: Yes; ComponentLink1URL: http://www.sunledusa.com/products/spec/XZMYK68W-2.pdf?src-supplier=Digi-Key; ComponentLink1Description: http://www.sunledusa.com/products/spec/XZMYK68W-2.pdf?src-supplier=Digi-Key; Supplier Part Number 1: 1497-1198-1-ND
LED9 = XZCBD68W-2: LED BLUE CLEAR 2SMD; Manufacturer: SunLED; Lens Color: Colorless; Luminous Intensity: 59mcd; Test Current: 20mA; Viewing Angle: 120°; Dominant Wavelength: 465nm; Forward Voltage: 3.3V; Supplier 1: Digi-Key; Manufacturer Part Number: XZCBD68W-2; RoHS: Yes; Category: LEDs; Stock 1: 9545; Pricing 1: 1=0.52000, 10=0.31700, 100=0.18240, 1000=0.14276 (USD); Mount: Surface Mount; Case/Package: 0402; Color: Blue; Packaging: Tape and Reel; Lens Transparency: Clear; Length: 1mm; Width: 0.5mm; Height: 0.5mm; RoHS Compliant: Yes; ComponentLink1URL: http://www.sunledusa.com/products/spec/XZCBD68W-2.pdf?src-supplier=Digi-Key; ComponentLink1Description: http://www.sunledusa.com/products/spec/XZCBD68W-2.pdf?src-supplier=Digi-Key; ComponentLink2URL: https://www.sunledusa.com/products/spec/XZCBD68W-2.pdf?src-supplier=Digi-Key; ComponentLink2Description: https://www.sunledusa.com/products/spec/XZCBD68W-2.pdf?src-supplier=Digi-Key; Supplier Part Number 1: 1497-1392-1-ND
R6 R7 = AC0603JR-0710KL: RES SMD 10K OHM 5% 1/10W 0603; Manufacturer: Yageo; Voltage Rating: 50V; Resistance: 10kR; Power Rating: 100mW; Temperature Coefficient: 100ppm/°C; Supplier 1: Future Electronics; Manufacturer Part Number: AC0603JR-0710KL; RoHS: Yes; Category: Chip SMD Resistors; Stock 1: 1533000; Pricing 1: 5000=0.00540 (USD); Case/Package: 0603; Case Code (Imperial): 0603; Case Code (Metric): 1608; Size Code: 0603; Min Operating Temperature: -55°C; Max Operating Temperature: 155°C; Packaging: Tape and Reel; Tolerance: 5%; Package Quantity: 1; Resistor Type: Thick Film; Termination: SMD/SMT; Number of Terminations: 2; Max Power Dissipation: 100mW; Features: Moisture Resistant,Automotive AEC-Q200,Anti-Sulfur; Series: AC; Construction: Rectangular; Length: 0.063inch; Width: 0.031inch; Height: 0.022inch; Depth: 0.8mm; Military Standard: Not; Lead Free: Lead Free; RoHS Compliant: Yes; ComponentLink1URL: https://datasheet.ciiva.com/5562/pyu-ac-51-rohs-l-2-5562553.pdf?src-supplier=Mouser; ComponentLink1Description: https://datasheet.ciiva.com/5562/pyu-ac-51-rohs-l-2-5562553.pdf?src-supplier=Mouser; Supplier Part Number 1: 1029044
R8 = CRGH0603J100K: RES SMD 100K OHM 5% 1/5W 0603; Manufacturer: TE Connectivity; Resistance: 100kR; Temperature Coefficient: 100ppm/°C; Power Rating: 200mW; Voltage Rating: 50V; Number of Resistors: 1; Supplier 1: Digi-Key; Manufacturer Part Number: CRGH0603J100K; Stock 1: 23277; Pricing 1: 1=0.1, 10=0.049, 100=0.02, 1000=0.00899, 2500=0.0078 (USD); Mount: Surface Mount; Case/Package: 0603; Case Code (Imperial): 0603; Case Code (Metric): 1608; Min Operating Temperature: -55°C; Max Operating Temperature: 125°C; Tolerance: 5%; Packaging: Tape and Reel; Resistor Type: Thick Film,Power resistor; Number of Terminations: 2; Series: CRGH; Termination: Solder; Voltage Rating (DC): 50V; Resistance Tolerance: 5%; Technology: THICK FILM; Length: 1.6mm; Width: 0.8mm; Height: 0.45mm; Depth: 0.8mm; RoHS Compliant: Yes; REACH SVHC: No SVHC; ELV: Compliant; ComponentLink1URL: http://www.farnell.com/datasheets/2007183.pdf?src-supplier=Element14; ComponentLink1Description: http://www.farnell.com/datasheets/2007183.pdf?src-supplier=Element14; Supplier Part Number 1: A126393DKR-ND
R10 = RC0603FR-071KL: RES SMD 1K OHM 1% 1/10W 0603; Manufacturer: Yageo; Resistance: 1kR; Temperature Coefficient: 100ppm/°C; Power Rating: 100mW; Voltage Rating: 50V; ComponentLink1URL: https://www.verical.com/server-webapp/html/getDatasheet?partID=409289&src-supplier=Verical; ComponentLink1Description: https://www.verical.com/server-webapp/html/getDatasheet?partID=409289&src-supplier=Verical; Supplier 1: Digi-Key; Manufacturer Part Number: RC0603FR-071KL; Stock 1: 21472395; Pricing 1: 1=0.1, 10=0.023, 100=0.0094, 1000=0.0042, 2500=0.0037 (USD); Case/Package: 0603; Contact Plating: Tin,Matte; Case Code (Imperial): 0603; Case Code (Metric): 1608; Min Operating Temperature: -55°C; Max Operating Temperature: 155°C; Tolerance: 1%; Composition: Thick Film; Packaging: Tape and Reel; Termination: SMD/SMT; Military Standard: Not; Length: 1.6mm; Height: 0.45mm; Depth: 0.8mm; Radiation Hardening: No; REACH SVHC: No SVHC; Lead Free: Lead Free; ComponentLink2URL: http://documents.rs-components.com/techlib://itc_doclist_GB.htm?stockno=5048928&src-supplier=RSComponents; ComponentLink2Description: http://documents.rs-components.com/techlib://itc_doclist_GB.htm?stockno=5048928&src-supplier=RSComponents; ComponentLink3URL: http://www.yageo.com/documents/recent/PYu-RC0603_51_RoHS_L_4.pdf?src-supplier=Avnet+Europe; ComponentLink3Description: http://www.yageo.com/documents/recent/PYu-RC0603_51_RoHS_L_4.pdf?src-supplier=Avnet+Europe; ComponentLink4URL: http://www.farnell.com/datasheets/2167052.pdf?src-supplier=Element14; ComponentLink4Description: http://www.farnell.com/datasheets/2167052.pdf?src-supplier=Element14; ComponentLink5URL: http://www.farnell.com/datasheets/1868787.pdf?src-supplier=Element14; ComponentLink5Description: http://www.farnell.com/datasheets/1868787.pdf?src-supplier=Element14; ComponentLink6URL: http://www.yageo.com/documents/recent/PYu-RC_Group_51_RoHS_L_2.pdf?src-supplier=Avnet; ComponentLink6Description: http://www.yageo.com/documents/recent/PYu-RC_Group_51_RoHS_L_2.pdf?src-supplier=Avnet; ComponentLink7URL: https://www.verical.com/server-webapp/html/getDatasheet?partID=404327&src-supplier=Verical; ComponentLink7Description: https://www.verical.com/server-webapp/html/getDatasheet?partID=404327&src-supplier=Verical; ComponentLink8URL: http://www.farnell.com/datasheets/443971.pdf?src-supplier=Element14; ComponentLink8Description: http://www.farnell.com/datasheets/443971.pdf?src-supplier=Element14; Supplier Part Number 1: 311-1.00KHRDKR-ND; LCSC Part Number: C22548
R11 = RT0603BRD0768KL: RES SMD 68K OHM 0.1% 1/10W 0603; Manufacturer: Yageo; Resistance: 68kR; Power Rating: 100mW; Voltage Rating: 75V; Temperature Coefficient: 25ppm/°C; Voltage Rating (DC): 50V; Supplier 1: Digi-Key; Manufacturer Part Number: RT0603BRD0768KL; RoHS: Yes; Category: Chip SMD Resistors; Stock 1: 45000; Pricing 1: 1=0.34000, 10=0.28800, 100=0.11260, 1000=0.04716, 2500=0.04322 (USD); Case/Package: 0603; Case Code (Metric): 1608; Case Code (Imperial): 0603; Contact Plating: Tin,Matte; Min Operating Temperature: -55°C; Max Operating Temperature: 125°C; Tolerance: 0.1%; Packaging: Tape and Reel; Resistor Type: Thin Film; Termination: SMD/SMT; Series: RT; Construction: Rectangular; Length: 1.6mm; Width: 800um; Depth: 0.8mm; Radiation Hardening: No; Military Standard: Not; Lead Free: Lead Free; RoHS Compliant: Yes; ComponentLink1URL: https://datasheet.ciiva.com/12694/pyu-rt-1-to-0-05-rohs-l-4-12694907.pdf?src-supplier=Mouser; ComponentLink1Description: https://datasheet.ciiva.com/12694/pyu-rt-1-to-0-05-rohs-l-4-12694907.pdf?src-supplier=Mouser; Supplier Part Number 1: YAG4586CT-ND
R12 R24 R32 R43-R47 = RC0603JR-07330RL: RES  SMD 330R 100 mW 0603; Manufacturer: Yageo; Power Rating: 100mW; Tolerance: 5%; Voltage Rating (DC): 50V; Temperature Coefficient: 100ppm/°C; Supplier 1: Digi-Key; Manufacturer Part Number: RC0603JR-07330RL; RoHS: Yes; Category: Chip SMD Resistors; Stock 1: 1074593; Pricing 1: 1=0.10000, 10=0.02000, 100=0.00800, 1000=0.00360, 2500=0.00312 (USD); Case/Package: 0603; Number of Pins: 2; Case Code (Imperial): 0603; Case Code (Metric): 1608; Size Code: 0603; Min Operating Temperature: -55°C; Max Operating Temperature: 155°C; Resistance: 330R; Packaging: Tape and Reel; Voltage Rating: 50V; Package Quantity: 5000; Termination: SMD/SMT; Resistor Type: Thick Film; Features: Moisture Resistant; Series: RC; Max Power Dissipation: 100mW; Number of Terminations: 2; Resistance Tolerance: 5%; Construction: Rectangular; Length: 1.6mm; Width: 0.8mm; Height: 0.45mm; Depth: 0.8mm; REACH SVHC: No SVHC; Lead Free: Lead Free; Military Standard: Not; RoHS Compliant: Yes; Supplier Part Number 1: 311-330GRCT-ND; LCSC Part Number: C105879
R48 = RT0603BRD07820KL: RES 820K OHM 0.1% 1/10W 0603; Manufacturer: Yageo; Supplier 1: Digi-Key; Manufacturer Part Number: RT0603BRD07820KL; RoHS: Yes; Category: Chip SMD Resistors; Stock 1: 28243; Pricing 1: 1=0.31000, 10=0.26600, 100=0.10410, 1000=0.04356, 2500=0.03994 (USD); ComponentLink1URL: http://www.yageo.com/documents/recent/PYu-RT_1-to-0.01_RoHS_L_9.pdf?src-supplier=Digi-Key; ComponentLink1Description: http://www.yageo.com/documents/recent/PYu-RT_1-to-0.01_RoHS_L_9.pdf?src-supplier=Digi-Key; Supplier Part Number 1: 13-RT0603BRD07820KLCT-ND
R49 = RC0603FR-07220RL: RES SMD 220 OHM 1% 1/10W 0603; Manufacturer: Yageo; Temperature Coefficient: 100ppm/°C; Voltage Rating (DC): 50V; Power Rating: 100mW; Supplier 1: Digi-Key; Manufacturer Part Number: RC0603FR-07220RL; Stock 1: 5843995; Pricing 1: 1=0.1, 10=0.023, 100=0.0094, 1000=0.00421, 2500=0.00366 (USD); Case/Package: 0603; Number of Pins: 2; Case Code (Imperial): 0603; Case Code (Metric): 1608; Min Operating Temperature: -55°C; Max Operating Temperature: 155°C; Resistance: 220R; Tolerance: 1%; Composition: Thick Film; Packaging: Tape and Reel; Voltage Rating: 50V; Package Quantity: 1; Termination: SMD/SMT; Number of Terminations: 2; Military Standard: Not; Max Power Dissipation: 100mW; Features: Moisture Resistant; Length: 1.6mm; Height: 0.022inch; Width: 0.031inch; Depth: 0.8mm; REACH SVHC: No SVHC; Lead Free: Lead Free; ComponentLink1URL: http://www.yageo.com/documents/recent/PYu-RC_Group_51_RoHS_L_10.pdf?src-supplier=Digi-Key; ComponentLink1Description: http://www.yageo.com/documents/recent/PYu-RC_Group_51_RoHS_L_10.pdf?src-supplier=Digi-Key; ComponentLink2URL: http://www.farnell.com/datasheets/1868787.pdf?src-supplier=Element14; ComponentLink2Description: http://www.farnell.com/datasheets/1868787.pdf?src-supplier=Element14; Supplier Part Number 1: 311-220HRCT-ND; LCSC Part Number: C107696
SB2-SB5 SB7-SB38 = Solder Bridge: Solder Bridge ON
U9 = MICRF220AYQS: RF RX ASK/OOK 300-450MHZ 16QSOP; Manufacturer: Microchip; Data Rate: 20Kbps; Nominal Supply Current: 4.3mA; Min Supply Voltage: 3V; Max Supply Voltage: 3.6V; Frequency: 450MHz; Sensitivity: -112.5dBm; Current - Receiving: 6mA; Bandwidth: 330kHz; Operating Frequency: 300 MHz to 450 MHz; Min Frequency: 300MHz; Supplier 1: Arrow Electronics; Manufacturer Part Number: MICRF220AYQS; RoHS: Yes; Category: Interface ICs; Stock 1: 5131; Pricing 1: 1=2.15000 (USD); Mount: Surface Mount; Case/Package: QSOP; Number of Pins: 16; Min Operating Temperature: -40°C; Max Operating Temperature: 105°C; Package Quantity: 98; Packaging: Rail/Tube; Series: QwikRadio®; Supply Current: 4.3mA; Max Frequency: 450MHz; Length: 4.9mm; Width: 3.91mm; Height: 1.47mm; Depth: 3.91mm; Radiation Hardening: No; RoHS Compliant: Yes; REACH SVHC: No SVHC; Lead Free: Lead Free; ComponentLink1URL: https://datasheet.ciiva.com/2798/micrf220-2798468.pdf?src-supplier=Digi-Key; ComponentLink1Description: https://datasheet.ciiva.com/2798/micrf220-2798468.pdf?src-supplier=Digi-Key; ComponentLink2URL: https://datasheet.ciiva.com/30475/0900766b81133813-30475820.pdf?src-supplier=RSComponents; ComponentLink2Description: https://datasheet.ciiva.com/30475/0900766b81133813-30475820.pdf?src-supplier=RSComponents; ComponentLink3URL: https://datasheet.ciiva.com/1164/micrf220-1164232.pdf?src-supplier=Element14; ComponentLink3Description: https://datasheet.ciiva.com/1164/micrf220-1164232.pdf?src-supplier=Element14; Supplier Part Number 1: MICRF220AYQS
U10 = SRX882-433MHZ: RF Modules ROHS; Manufacturer: G-NiceRF; Manufacturer Part Number: SRX882-433MHZ; LCSC Part Number: C5126754; ComponentLink1Description: LCSC; ComponentLink1URL: https://www.lcsc.com/product-detail/RF-Modules_G-NiceRF-STX882S-433MHZ-SRX882-433MHZ-SW433-TH32_C5126754.html
U11 = HC-12 Module: 433Mhz SI4463 HC-12 Wireless Serial Port Module; ComponentLink1Description: Aliexpress; ComponentLink1URL: https://www.aliexpress.com/item/1005002117548373.html?spm=a2g0o.productlist.main.1.451c79c6Vo7dNy&algo_pvid=93082d1e-6c79-45a0-b51e-4c9c862db0c1&algo_exp_id=93082d1e-6c79-45a0-b51e-4c9c862db0c1-0&pdp_ext_f=%7B%22sku_id%22%3A%2212000018797976000%22%7D&pdp_npi=2%40dis%21USD%214.4%213.74%21%21%21%21%21%4021224e9b16655822763592696d06c5%2112000018797976000%21sea&curPageLogUid=P8YFabe8JKJ6; Manufacturer Part Number: HC-12
U12 = PT2272-L4S: SOP-20_300mil Interface - Specialized ROHS; Manufacturer: PTC; Manufacturer Part Number: PT2272-L4S; LCSC Part Number: C80963; ComponentLink1Description: LCSC; ComponentLink1URL: https://www.lcsc.com/product-detail/Interface-Specialized_PTC-Princeton-Tech-PT2272-L4S_C80963.html
U13 = HT12D-20SOPLF: Remote Control Decoder, SMD, SOP20; Manufacturer: Holtek; Nominal Supply Current: 200uA; Min Supply Voltage: 2.4V; Max Supply Voltage: 12V; Supplier 1: Newark; Manufacturer Part Number: HT12D-20SOPLF; RoHS: Yes; Category: Integrated Circuits (ICs); Pricing 1: 1=2.11000, 10=1.80000, 100=1.44000, 500=1.33000, 1000=1.19000, 2500=0.96900, 5000=0.93700 (USD); Number of Pins: 20; Min Operating Temperature: -20°C; Max Operating Temperature: 75°C; REACH SVHC: No SVHC; ComponentLink1URL: https://datasheet.ciiva.com/1176/1525377-1176091.pdf?src-supplier=Newark; ComponentLink1Description: https://datasheet.ciiva.com/1176/1525377-1176091.pdf?src-supplier=Newark; ComponentLink2URL: https://datasheet.ciiva.com/1167/57850-1167133.pdf?src-supplier=Element14; ComponentLink2Description: https://datasheet.ciiva.com/1167/57850-1167133.pdf?src-supplier=Element14; Supplier Part Number 1: 53M7832
X2 = S1C13523ZWFAC: 13.52313MHz In-line passive crystal oscillator 20pF 60Ω ±20ppm ±30ppm -40℃~+85℃ HC-49S-2P Crystals ROHS; Manufacturer: JYJE; Manufacturer Part Number: S1C13523ZWFAC; Package: HC-49S-2P; LCSC Part Number: C2681243; ComponentLink1Description: LCSC; ComponentLink1URL: https://www.lcsc.com/product-detail/Crystals_JYJE-S1C13523ZWFAC_C2681243.html

## Nets that join several sheets
GND: Motor_Driver_Section (15 pins), Connector_Section (21 pins), Power_Section (25 pins), Controller_Section (15 pins), Current_Sense_Section (11 pins), RF_Receiver_Section (34 pins)
VCC: Connector_Section (J1.2 J1.3 J2.1 P5.6), Power_Section (8 pins), Controller_Section (R2.2)
VCC#: Power_Section (10 pins), Current_Sense_Section (U6.3 U6.4)
VCC_3V3: Power_Section (C45.1 U8.1), RF_Receiver_Section (6 pins)
VCC_5V: Connector_Section (LS1.1 P3.2 R25.2 R27.2), Power_Section (9 pins), Controller_Section (9 pins), Current_Sense_Section (C30.1 C32.1 U6.8), RF_Receiver_Section (10 pins)
VCC_M: Motor_Driver_Section (10 pins), Power_Section (R38.2 R39.1)
~{SD1}: Motor_Driver_Section (R14.1 U3.3), Controller_Section (U2.9)
~{SD2}: Motor_Driver_Section (R15.1 U4.3), Controller_Section (U2.2)
BUZZER: Connector_Section (R5.2), Controller_Section (U2.11)
CNTRL2#: Controller_Section (P2.5 U2.15), RF_Receiver_Section (SB19.2 SB35.2)
CNTRL3#: Connector_Section (Q13.3), Controller_Section (P2.1 U2.16)
CNTRL4#: Connector_Section (Q14.3), Controller_Section (P2.2 U2.17)
CRNT_SNS: Controller_Section (U2.23), Current_Sense_Section (C29.1 R34.1 R35.2)
DRV_IN: Motor_Driver_Section (U3.2), Controller_Section (SB1.1)
DRV_IN2: Motor_Driver_Section (U4.2), Controller_Section (SB6.1)
IPP: Motor_Driver_Section (Q6.2 Q8.2), Current_Sense_Section (7 pins)
LCD_4: Connector_Section (P3.4), Controller_Section (U2.1)
LCD_11: Connector_Section (P3.11), Controller_Section (U2.28)
LCD_12: Connector_Section (P3.12 R42.1), Controller_Section (U2.27)
LCD_13: Connector_Section (P3.13 R41.1), Controller_Section (U2.26)
LCD_14: Connector_Section (P3.14 R40.1), Controller_Section (U2.25)
LCD_EN: Connector_Section (P3.6), Controller_Section (U2.32)
MCU_RX: Controller_Section (U2.30), RF_Receiver_Section (7 pins)
MCU_TX: Controller_Section (U2.31), RF_Receiver_Section (SB12.2 SB18.2 SB34.2)
PB0: Controller_Section (U2.12), RF_Receiver_Section (7 pins)
SPOOL_SNS: Motor_Driver_Section (C28.1 D4.1 R16.2 R17.2), Controller_Section (U2.24)